# Altium schematic sheet 主体.schdoc
size 297 x 209 mm; Symbol: Drawing-Symbol_A4; @Create Time: 10:59:36; @Update Time: 20:11:28; Border: 1; Width: 1170; Height: 825; Region Start: 1; X Region Count: 6; Y Region Count: 4; Blade Width: 10; Title Block Position: 3; Title Block: 1; @Board Name: Board1; Company: 嘉立创EDA; Version: V1.0; Page Size: A4; @Project Name: stm32f4; @Page Count: 3; @Update Date: 2025-11-17; @Create Date: 2025-10-30; @Schematic Name: Schematic1; @Page No: 1; @Page Name: 主体; Device: Drawing-Symbol_A4
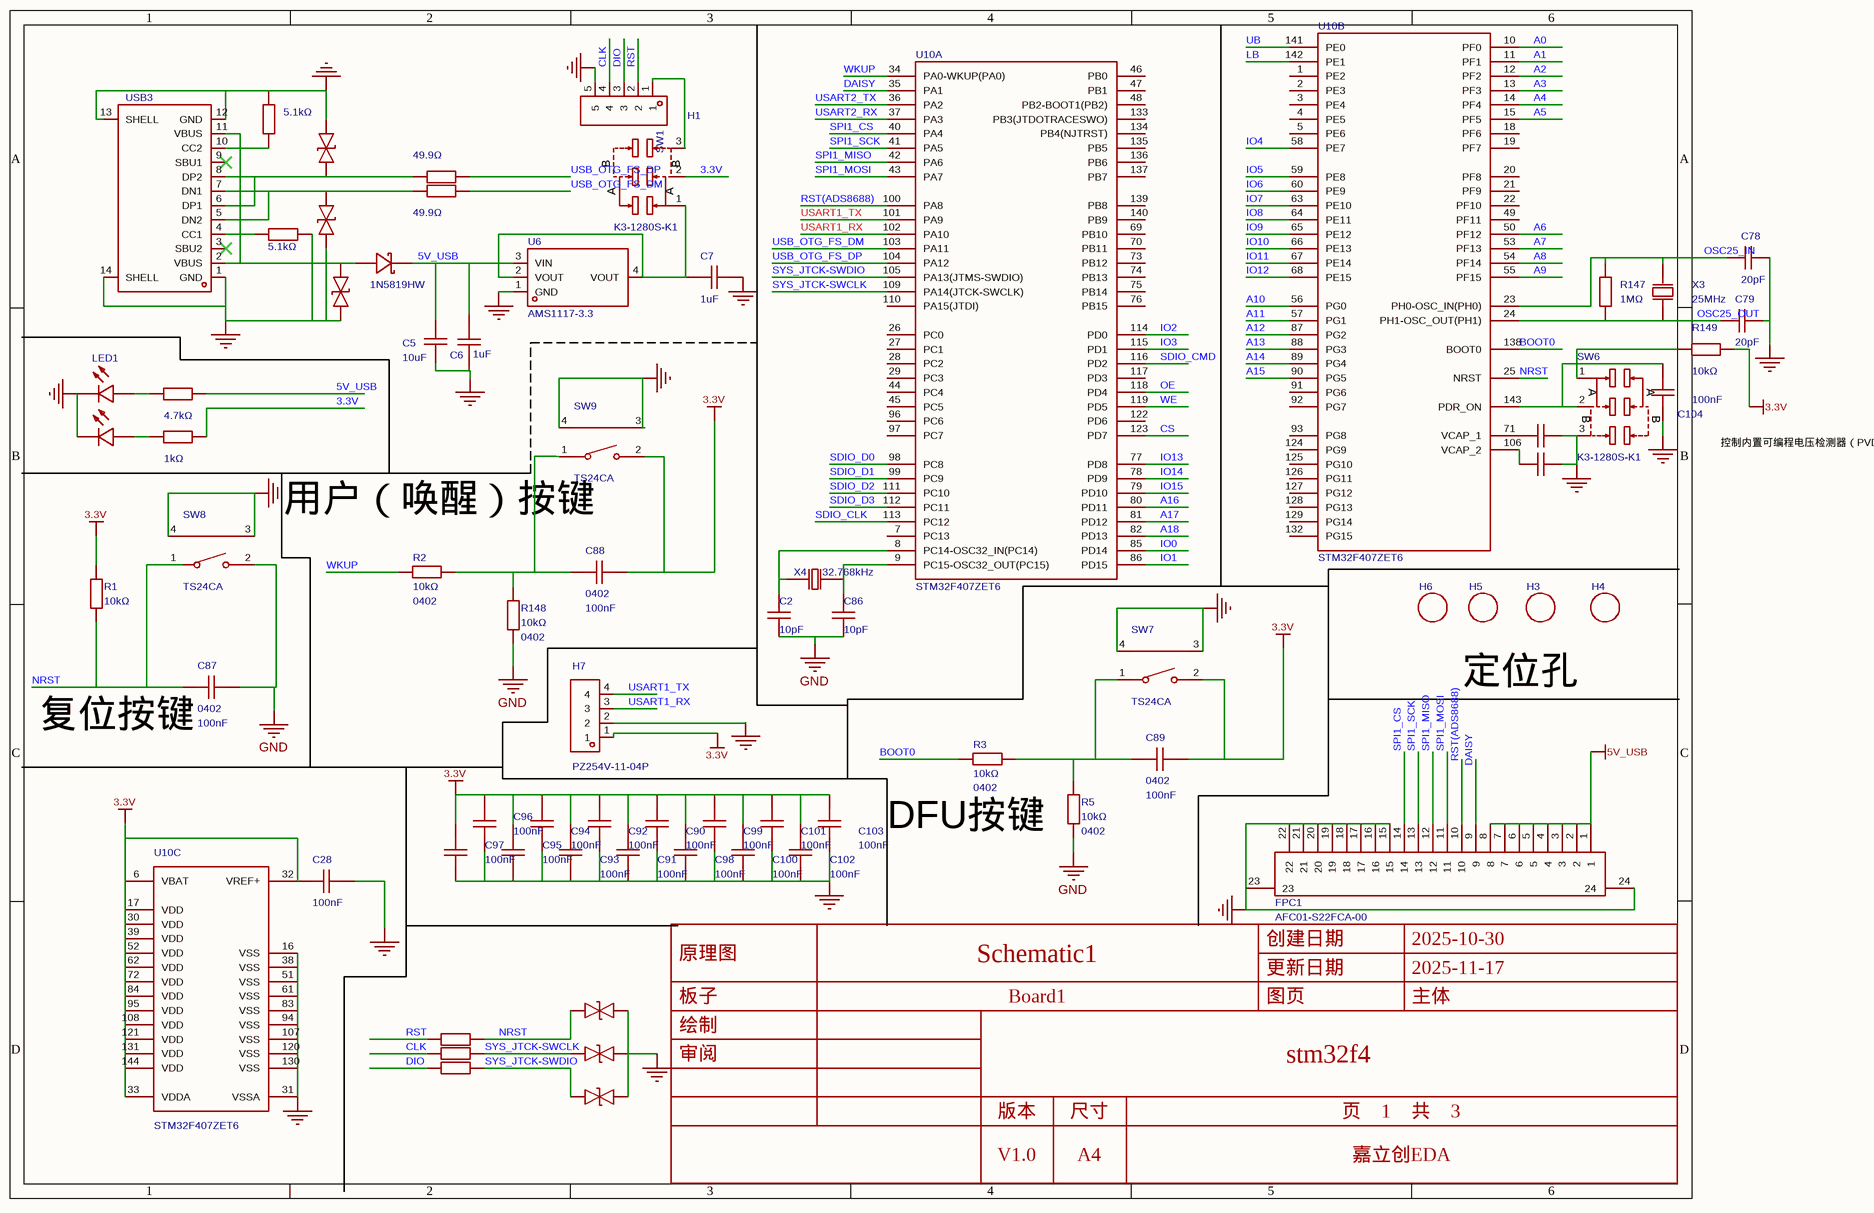
[diagram p0: 主体.schdoc]

## Parts
C2  value 10pF  [r0402]
C5  10uF  [C0603]
C6  1uF  [C0603]
C7  1uF  [C0603]
C28  100nF  [C0603]
C78  20pF  [C0603]
C79  20pF  [C0603]
C80  2.2uF  [C0603]  (value not drawn)
C81  2.2uF  [C0603]  (value not drawn)
C86  value 10pF  [r0402]
C87  value 100nF  Supplier Footprint: 0402  [C0402]  (hidden comment: CC0402KRX7R7BB104)
C88  value 100nF  Supplier Footprint: 0402  [C0402]  (hidden comment: CC0402KRX7R7BB104)
C89  value 100nF  Supplier Footprint: 0402  [C0402]  (hidden comment: CC0402KRX7R7BB104)
C90  100nF  [C0402]
C91  100nF  [C0402]
C92  100nF  [C0402]
C93  100nF  [C0402]
C94  100nF  [C0402]
C95  100nF  [C0402]
C96  100nF  [C0402]
C97  100nF  [C0402]
C98  100nF  [C0402]
C99  100nF  [C0402]
C100  100nF  [C0402]
C101  100nF  [C0402]
C102  100nF  [C0402]
C103  100nF  [C0402]
C104  100nF  [C0402]
D9  0603ESDA-05N  [D0603-BI]  (value not drawn)
D10  0603ESDA-05N  [D0603-BI]  (value not drawn)
D11  0603ESDA-05N  [D0603-BI]  (value not drawn)
D13  LESD5D5.0CT1G  [SOD-523_L1.2-W0.8-LS1.6-BI]  (value not drawn)
D14  LESD5D5.0CT1G  [SOD-523_L1.2-W0.8-LS1.6-BI]  (value not drawn)
D15  LESD5D5.0CT1G  [SOD-523_L1.2-W0.8-LS1.6-BI]  (value not drawn)
D16  1N5819HW  [SOD-123_L2.7-W1.6-LS3.7-RD-1]
FPC1  AFC01-S22FCA-00  [FPC-SMD_P0.5-22P_FGS-XJ-H2.0]
H1  PZ254V-11-05P  [HDR-TH_5P-P2.54-V-M]  (value not drawn)
H3  m3_3  [m3 125x300]  (value not drawn)
H4  m3_3  [m3 125x300]  (value not drawn)
H5  m3_3  [m3 125x300]  (value not drawn)
H6  m3_3  [m3 125x300]  (value not drawn)
H7  PZ254V-11-04P  [HDR-TH_4P-P2.54-V-M]
LED1  19-217/R6C-AL1M2VY/3T  [LED0603-RD]  (value not drawn)
LED5  19-213/Y2C-CQ2R2L/3T(CY)  [LED0603-RD-YELLOW]  (value not drawn)
R1  value 10kΩ  [R0402]  (hidden comment: RC0402FR-0710KL)
R2  value 10kΩ  Supplier Footprint: 0402  [R0402]  (hidden comment: RC0402FR-0710KL)
R3  value 10kΩ  Supplier Footprint: 0402  [R0402]  (hidden comment: RC0402FR-0710KL)
R5  value 10kΩ  Supplier Footprint: 0402  [R0402]  (hidden comment: RC0402FR-0710KL)
R7  49.9Ω  [R0603]  (value not drawn)
R8  49.9Ω  [R0603]  (value not drawn)
R9  49.9Ω  [R0603]  (value not drawn)
R21  value 49.9Ω  [R0603]  (hidden comment: 0603WAF499JT5E)
R22  value 49.9Ω  [R0603]  (hidden comment: 0603WAF499JT5E)
R24  5.1kΩ  [R0402]
R25  5.1kΩ  [R0402]
R26  4.7kΩ  [R0402]
R27  1kΩ  [R0402]
R147  1MΩ  [R0603]
R148  value 10kΩ  Supplier Footprint: 0402  [R0402]  (hidden comment: RC0402FR-0710KL)
R149  10kΩ  [R0402]
SW1  K3-1280S-K1  [SW-SMD_K3-1280S-K1]
SW6  K3-1280S-K1  [SW-SMD_K3-1280S-K1]
SW7  TS24CA  [SW-SMD_2P-TS24CA]
SW8  TS24CA  [SW-SMD_2P-TS24CA]
SW9  TS24CA  [SW-SMD_2P-TS24CA]
U6  AMS1117-3.3  [SOT-223-3_L6.5-W3.4-P2.30-LS7.0-BR]
U10  STM32F407ZET6  [LQFP-144_L20.0-W20.0-P0.50-LS22.0-BL]  (parts A,B,C of 3)
USB3  TYPE-C 16PIN 2MD(073)  [USB-C-SMD_TYPE-C-6PIN-2MD-073]  (value not drawn)
X3  25MHz  [OSC-SMD_L5.0-W3.2]
X4  value 32.768kHz  [crystal-smd_l3.2-w1.5-1]

## Nets
3.3V: C28.1 C88.1 C89.1 C90.1 C91.1 C92.1 C93.1 C94.1 C95.1 C96.1 C97.1 C98.1 C99.1 C100.1 C101.1 C102.1 C103.1 H7.1 R1.1 R27.2 R149.2 SW1.2 SW7.2 SW9.2 U10.6(VBAT) U10.17(VDD) U10.30(VDD) U10.32(VREF+) U10.33(VDDA) U10.39(VDD) U10.52(VDD) U10.62(VDD) U10.72(VDD) U10.84(VDD) U10.95(VDD) U10.108(VDD) U10.121(VDD) U10.131(VDD) U10.144(VDD)
5V_USB: C5.2 C6.2 D16.1(K) FPC1.1 FPC1.2 FPC1.3 FPC1.4 FPC1.5 FPC1.6 FPC1.7 FPC1.8 R26.2 U6.3(VIN)
GND: C2.1 C5.1 C6.1 C7.2 C28.2 C78.1 C79.1 C80.2 C81.2 C86.1 C87.1 C90.2 C91.2 C92.2 C93.2 C94.2 C95.2 C96.2 C97.2 C98.2 C99.2 C100.2 C101.2 C102.2 C103.2 C104.1 D9.2 D10.2 D11.2 D13.1 D14.1 D15.1 FPC1.15 FPC1.16 FPC1.17 FPC1.18 FPC1.19 FPC1.20 FPC1.21 FPC1.22 FPC1.23 FPC1.24 H1.5 H7.2 LED1.1(C) LED5.1(C) R5.2 R24.2 R25.2 R148.2 SW6.3 SW7.3 SW7.4 SW8.2 SW8.3 SW8.4 SW9.3 SW9.4 U6.1(GND) U10.16(VSS) U10.31(VSSA) U10.38(VSS) U10.51(VSS) U10.61(VSS) U10.83(VSS) U10.94(VSS) U10.107(VSS) U10.120(VSS) U10.130(VSS) USB3.1(GND) USB3.12(GND) USB3.13(SHELL) USB3.14(SHELL)
A0: U10.10(PF0)
A1: U10.11(PF1)
A2: U10.12(PF2)
A3: U10.13(PF3)
A4: U10.14(PF4)
A5: U10.15(PF5)
A6: U10.50(PF12)
A7: U10.53(PF13)
A8: U10.54(PF14)
A9: U10.55(PF15)
A10: U10.56(PG0)
A11: U10.57(PG1)
A12: U10.87(PG2)
A13: U10.88(PG3)
A14: U10.89(PG4)
A15: U10.90(PG5)
A16: U10.80(PD11)
A17: U10.81(PD12)
A18: U10.82(PD13)
BOOT0: R3.1 U10.138(BOOT0)
CLK: H1.4 R8.1
CS: U10.123(PD7)
DAISY: FPC1.9 U10.35(PA1)
DIO: H1.3 R9.1
IO0: U10.85(PD14)
IO1: U10.86(PD15)
IO2: U10.114(PD0)
IO3: U10.115(PD1)
IO4: U10.58(PE7)
IO5: U10.59(PE8)
IO6: U10.60(PE9)
IO7: U10.63(PE10)
IO8: U10.64(PE11)
IO9: U10.65(PE12)
IO10: U10.66(PE13)
IO11: U10.67(PE14)
IO12: U10.68(PE15)
IO13: U10.77(PD8)
IO14: U10.78(PD9)
IO15: U10.79(PD10)
LB: U10.142(PE1)
NRST: C87.2 D9.1 R1.2 R7.2 SW8.1 U10.25(NRST)
OE: U10.118(PD4)
OSC25_IN: C78.2 R147.2 U10.23(PH0-OSC_IN(PH0)) X3.2(OSC2)
OSC25_OUT: C79.2 R147.1 U10.24(PH1-OSC_OUT(PH1)) X3.1(OSC1)
RST: H1.2 R7.1
RST(ADS8688): FPC1.10 U10.100(PA8)
SDIO_CLK: U10.113(PC12)
SDIO_CMD: U10.116(PD2)
SDIO_D0: U10.98(PC8)
SDIO_D1: U10.99(PC9)
SDIO_D2: U10.111(PC10)
SDIO_D3: U10.112(PC11)
SPI1_CS: FPC1.14 U10.40(PA4)
SPI1_MISO: FPC1.12 U10.42(PA6)
SPI1_MOSI: FPC1.11 U10.43(PA7)
SPI1_SCK: FPC1.13 U10.41(PA5)
SYS_JTCK-SWCLK: D10.1 R8.2 U10.109(PA14(JTCK-SWCLK))
SYS_JTCK-SWDIO: D11.1 R9.2 U10.105(PA13(JTMS-SWDIO))
UB: U10.141(PE0)
USART1_RX: H7.3 U10.102(PA10)
USART1_TX: H7.4 U10.101(PA9)
USART2_RX: U10.37(PA3)
USART2_TX: U10.36(PA2)
USB_OTG_FS_DM: R22.1 U10.103(PA11)
USB_OTG_FS_DP: R21.1 U10.104(PA12)
WE: U10.119(PD5)
WKUP: R2.1 U10.34(PA0-WKUP(PA0))
NetC2_2: C2.2 U10.8(PC14-OSC32_IN(PC14)) X4.1
NetC7_1: C7.1 SW1.1 U6.2(VOUT) U6.4(VOUT)
NetC80_1: C80.1 U10.71(VCAP_1)
NetC81_1: C81.1 U10.106(VCAP_2)
NetC86_2: C86.2 U10.9(PC15-OSC32_OUT(PC15)) X4.2
NetC88_2: C88.2 R2.2 R148.1 SW9.1
NetC89_2: C89.2 R3.2 R5.1 SW7.1
NetC104_2: C104.2 SW6.2 U10.143(PDR_ON)
NetD13_2: D13.2 R21.2 USB3.6(DP1) USB3.8(DP2)
NetD14_2: D14.2 R22.2 USB3.5(DN2) USB3.7(DN1)
NetD15_2: D15.2 D16.2(A) USB3.2(VBUS) USB3.11(VBUS)
NetH1_1: H1.1 SW1.3
NetLED1_2: LED1.2(A) R26.1
NetLED5_2: LED5.2(A) R27.1
NetR24_1: R24.1 USB3.10(CC2)
NetR25_1: R25.1 USB3.4(CC1)
NetR149_1: R149.1 SW6.1

Not connected (* = marked no-connect by the designer): U10 1(PE2) 2(PE3) 3(PE4) 4(PE5) 5(PE6) 7(PC13) 18(PF6) 19(PF7) 20(PF8) 21(PF9) 22(PF10) 26(PC0) 27(PC1) 28(PC2) 29(PC3) 44(PC4) 45(PC5) 46(PB0) 47(PB1) 48(PB2-BOOT1(PB2)) 49(PF11) 69(PB10) 70(PB11) 73(PB12) 74(PB13) 75(PB14) 76(PB15) 91(PG6) 92(PG7) 93(PG8) 96(PC6) 97(PC7) 110(PA15(JTDI)) 117(PD3) 122(PD6) 124(PG9) 125(PG10) 126(PG11) 127(PG12) 128(PG13) 129(PG14) 132(PG15) 133(PB3(JTDOTRACESWO)) 134(PB4(NJTRST)) 135(PB5) 136(PB6) 137(PB7) 139(PB8) 140(PB9); USB3 3(SBU2)* 9(SBU1)*

## Notes on the sheet
- 控制内置可编程电压检测器（PVD）的开启/关闭
- 用户（唤醒）按键
- 定位孔
- 复位按键
- DFU按键
- 创建日期
- 2025-10-30
- 原理图
- 板子
- Schematic1
- Board1
- 更新日期
- 图页
- 2025-11-17
- 主体
- 绘制
- 审阅
- stm32f4
- 版本
- V1.0
- 尺寸
- A4
- 页    1    共    3
- 嘉立创EDA
- (in symbol K3-1280S-K1) B; A

## Library data of the parts
C2 C86 = CC0402JRNPO9BN100: 容值:10pF;精度:±5%;额定电压:50V;温度系数:NP0;; Manufacturer: YAGEO(国巨); AddInBom: yes; ModelId: 36a51122f27c49738f86b3bfa98863e0; ModelName: C0402_L1.0-W0.5-H0.5; ModelTransform: 39.37,19.685,0,0,0,0,0,0,0; Tolerance: ±5%; Voltage Rated: 50V; Temperature Coefficient: NP0; Device: CC0402JRNPO9BN100; Symbol: cc0402jrnpo9bn100; LCSC Part Name: 10pF ±5% 50V; SupplierPart: C106199; ManufacturerPart: CC0402JRNPO9BN100; Supplier Footprint: 0402; JLCPCB Part Class: Extended Part; Datasheet: https://atta.szlcsc.com/upload/public/pdf/source/20170518/1495085708228.pdf; Supplier: LCSC; ConvertToPcb: yes; FootprintName: r0402
C5 = 0603X106K100NT: 容值:10uF;精度:±10%;额定电压:10V;材质(温度系数):X5R;; Manufacturer: FH(风华); AddInBom: yes; ModelId: ac125912035d415993ca9572d50418b1; ModelName: C0603_L1.6-W0.8-H0.8; ModelTransform: 62.992,31.496,0,0,0,0,0,0,0; Tolerance: ±10%; Voltage Rated: 10V; Temperature Coefficient: X5R; Device: 0603X106K100NT; Symbol: 0603X106K100NT; LCSC Part Name: 10uF ±10% 10V; SupplierPart: C38898; ManufacturerPart: 0603X106K100NT; Supplier Footprint: 0603; Datasheet: https://atta.szlcsc.com/upload/public/pdf/source/20170923/C38898_1506149449306988751.pdf; Supplier: LCSC; ConvertToPcb: yes; FootprintName: C0603; Value: 10uF
C6 C7 = CL10A105KB8NNNC: 容值:1uF;精度:±10%;额定电压:50V;温度系数:X5R;; Manufacturer: SAMSUNG(三星); AddInBom: yes; ModelId: ac125912035d415993ca9572d50418b1; ModelName: C0603_L1.6-W0.8-H0.8; ModelTransform: 62.992,31.496,0,0,0,0,0,0,0; Tolerance: ±10%; Voltage Rating: 50V; Temperature Coefficient: X5R; Symbol: CL10A105KB8NNNC; Device: CL10A105KB8NNNC; LCSC Part Name: 1uF ±10% 50V; SupplierPart: C15849; ManufacturerPart: CL10A105KB8NNNC; Supplier Footprint: 0603; JLCPCB Part Class: 基础库; Datasheet: https://item.szlcsc.com/datasheet/CL10A105KB8NNNC/16531.html; Supplier: LCSC; ConvertToPcb: yes; FootprintName: C0603; Value: 1uF
C28 = CC0603KRX7R9BB104: 容值:100nF;精度:±10%;额定电压:50V;材质(温度系数):X7R;; Manufacturer: YAGEO(国巨); Voltage Rating: 50V; AddInBom: yes; ModelId: ac125912035d415993ca9572d50418b1; ModelName: C0603_L1.6-W0.8-H0.8; ModelTransform: 62.992,31.496,0,0,0,0,0,0,0; Tolerance: ±10%; Temperature Coefficient: X7R; Symbol: CC0603KRX7R9BB104; Device: CC0603KRX7R9BB104; LCSC Part Name: 100nF ±10% 50V; SupplierPart: C14663; ManufacturerPart: CC0603KRX7R9BB104; Supplier Footprint: 0603; JLCPCB Part Class: 基础库; Datasheet: https://atta.szlcsc.com/upload/public/pdf/source/20180910/C282072_33301C7F631E79921B82A8DAC6BCC5B3.pdf; Supplier: LCSC; ConvertToPcb: yes; FootprintName: C0603; Value: 100nF; Voltage Rated: 50V
C78 C79 = CL10C200JB8NNNC: 容值:20pF;精度:±5%;额定电压:50V;温度系数:C0G;; Manufacturer: SAMSUNG(三星); AddInBom: yes; ModelId: ac125912035d415993ca9572d50418b1; ModelName: C0603_L1.6-W0.8-H0.8; ModelTransform: 62.992,31.496,0,0,0,0,0,0,0; Tolerance: ±5%; Voltage Rating: 50V; Temperature Coefficient: C0G; Symbol: CL10C200JB8NNNC; Device: CL10C200JB8NNNC; LCSC Part Name: 20pF ±5% 50V; SupplierPart: C1648; ManufacturerPart: CL10C200JB8NNNC; Supplier Footprint: 0603; JLCPCB Part Class: 基础库; Datasheet: https://item.szlcsc.com/datasheet/CL10C200JB8NNNC/2000.html; Supplier: LCSC; ConvertToPcb: yes; FootprintName: C0603; Value: 20pF
C80 C81 = CL10A225KO8NNNC: 容值:2.2uF;精度:±10%;额定电压:16V;温度系数:X5R;; Manufacturer: SAMSUNG(三星); AddInBom: yes; ModelId: ac125912035d415993ca9572d50418b1; ModelName: C0603_L1.6-W0.8-H0.8; ModelTransform: 62.992,31.496,0,0,0,0,0,0,0; Tolerance: ±10%; Voltage Rating: 16V; Temperature Coefficient: X5R; Symbol: CL10A225KO8NNNC; Device: CL10A225KO8NNNC; LCSC Part Name: 2.2uF ±10% 16V; SupplierPart: C23630; ManufacturerPart: CL10A225KO8NNNC; Supplier Footprint: 0603; JLCPCB Part Class: 基础库; Datasheet: https://item.szlcsc.com/datasheet/CL10A225KO8NNNC/24366.html; Supplier: LCSC; ConvertToPcb: yes; FootprintName: C0603; Value: 2.2uF
C87-C89 C104 = CC0402KRX7R7BB104: 容值:100nF;精度:±10%;额定电压:16V;材质(温度系数):X7R;; Manufacturer: YAGEO(国巨); AddInBom: yes; ModelId: 36a51122f27c49738f86b3bfa98863e0; ModelName: C0402_L1.0-W0.5-H0.5; ModelTransform: 39.37,19.685,0,0,0,0,0,0,0; Tolerance: ±10%; Voltage Rated: 16V; Temperature Coefficient: X7R; Device: CC0402KRX7R7BB104; Symbol: CC0402KRX7R7BB104; LCSC Part Name: 100nF ±10% 16V; SupplierPart: C60474; ManufacturerPart: CC0402KRX7R7BB104; Datasheet: https://atta.szlcsc.com/upload/public/pdf/source/20211223/9278FD768280B81DDBEF48FA36411A03.pdf; Supplier: LCSC; ConvertToPcb: yes; FootprintName: C0402
  C104: Supplier Footprint: 0402; Value: 100nF
C90-C103 = CL05B104KB54PNC: 容值:100nF;精度:±10%;额定电压:50V;温度系数:X7R;; Manufacturer: SAMSUNG(三星); AddInBom: yes; ModelId: 36a51122f27c49738f86b3bfa98863e0; ModelName: C0402_L1.0-W0.5-H0.5; ModelTransform: 39.37,19.685,0,0,0,0,0,0,0; Tolerance: ±10%; Voltage Rating: 50V; Temperature Coefficient: X7R; Symbol: CL05B104KB54PNC; Device: CL05B104KB54PNC; LCSC Part Name: 100nF ±10% 50V; SupplierPart: C307331; ManufacturerPart: CL05B104KB54PNC; Supplier Footprint: 0402; JLCPCB Part Class: 基础库; Datasheet: https://item.szlcsc.com/datasheet/CL05B104KB54PNC/291005.html; Supplier: LCSC; ConvertToPcb: yes; FootprintName: C0402; Value: 100nF
D9-D11 = 0603ESDA-05N: 极性:双向;反向截止电压(Vrwm):5V;钳位电压:50V;; Manufacturer: BORN(伯恩半导体); AddInBom: yes; ModelId: a387ce2936f842ebafc868b09fdf8ecc; ModelName: DO0603_L1.6-W0.8-H0.8-LS1.6; ModelTransform: 62.992,31.496,0,0,0,0,0,0,0; Polarity: 双向; Reverse Stand-Off Voltage (Vrwm): 5V; Clamping Voltage: 50V; Reverse Leakage Current (Ir): 500nA; level of protection: IEC 61000-4-2; Type: ESD; Junction Capacitance: 1.5pF; Symbol: 0603ESDA-05N; Device: 0603ESDA-05N; LCSC Part Name: 双向ESD 5V截止; SupplierPart: C316054; ManufacturerPart: 0603ESDA-05N; Supplier Footprint: 0603; JLCPCB Part Class: 扩展库; Datasheet: https://item.szlcsc.com/datasheet/0603ESDA-05N/297742.html; Supplier: LCSC; ConvertToPcb: yes; FootprintName: D0603-BI
D13-D15 = LESD5D5.0CT1G: 极性:双向;反向截止电压(Vrwm):5V;钳位电压:18.6V;峰值脉冲电流(Ipp):9.4A@8/20us;峰值脉冲功率(Ppp):150W@8/20us;击穿电压:7.8V;; Manufacturer: LRC(乐山无线电); AddInBom: yes; ModelId: bfbc20aaa9964d25bc07bd43d1c87046; ModelTransform: 62.992,31.496,0,0,0,0,0,0,0; Polarity: 双向; Reverse Stand-Off Voltage (Vrwm): 5V; Clamping Voltage: 18.6V; Voltage - Breakdown: 7.8V; Reverse Leakage Current (Ir): 1uA; level of protection: IEC 61000-4-4；IEC 61000-4-2; Type: ESD; Junction Capacitance: 15pF; Symbol: LESD5D5.0CT1G; Device: LESD5D5.0CT1G; LCSC Part Name: 双向ESD 5V截止 峰值脉冲电流：9.4A@8/20us; SupplierPart: C383211; ManufacturerPart: LESD5D5.0CT1G; Supplier Footprint: SOD-523; JLCPCB Part Class: 扩展库; Datasheet: https://item.szlcsc.com/datasheet/LESD5D5.0CT1G/356518.html; Supplier: LCSC; ConvertToPcb: yes; FootprintName: SOD-523_L1.2-W0.8-LS1.6-BI; ModelName: SOD-523_L1.2-W0.8-LS1.6-BI; Peak Pulse Current (Ipp): 9.4A@8/20us; Peak Pulse Power Dissipation (Ppp): 150W@8/20us; Operating Temperature: -40℃~+125℃
D16 = 1N5819HW: 二极管配置:-;正向压降(Vf):900mV@3A;直流反向耐压(Vr):40V;整流电流:1A;; Manufacturer: TECH PUBLIC(台舟); AddInBom: yes; ModelId: 528459655f7d4601a76356f3191c812b; ModelTransform: 151.575,66.929,0,0,0,0,0,0,0; Voltage - DC Reverse(Vr): 40V; Current - Rectified: 1A; Reverse Leakage Current (Ir): 1mA@40V; Non-Repetitive Peak Forward Surge Current: 9A; Symbol: 1N5819HW; Device: 1N5819HW; LCSC Part Name: 电压:40V 电流:1A; SupplierPart: C2905649; ManufacturerPart: 1N5819HW; Supplier Footprint: SOD-123; JLCPCB Part Class: 扩展库; Datasheet: https://item.szlcsc.com/datasheet/1N5819HW/3175946.html; Supplier: LCSC; ConvertToPcb: yes; FootprintName: SOD-123_L2.7-W1.6-LS3.7-RD-1; ModelName: SOD-123_L2.7-W1.6-LS3.7-RD-1; Diode Configuration: -; Voltage - Forward(Vf@If): 900mV@3A
FPC1 = AFC01-S22FCA-00: 锁定特性:翻盖式;触点类型:下接;触点数量:22P;间距:0.5mm;安装类型:卧贴;; Manufacturer: JS(钜硕电子); AddInBom: yes; ModelId: 12d9165dec84425d968f174b1be8289a; ModelTransform: 610.235,240.157,0,0,0,0,0,57.008,0; Locking Feature: 翻盖式; Number of Contacts: 22P; Pitch: 0.5mm; FFC, FCB Thickness: 0.3mm; Symbol: AFC01-S22FCA-00; Device: AFC01-S22FCA-00; LCSC Part Name: 间距:0.5mm P数:22P 翻盖式 下接; SupplierPart: C262668; ManufacturerPart: AFC01-S22FCA-00; Supplier Footprint: SMD,P=0.5mm,卧贴; JLCPCB Part Class: 扩展库; Datasheet: https://atta.szlcsc.com/upload/public/pdf/source/20190816/C413942_2A72D1AC756EAE17EEDF756A339D4500.pdf; Supplier: LCSC; ConvertToPcb: yes; FootprintName: FPC-SMD_P0.5-22P_FGS-XJ-H2.0; ModelName: FPC-SMD_P0.5-22P_FGS-XJ-H2.0; Contact Type: 下接; Mounting Type: 卧贴; Height Above Board: 2mm
H1 = PZ254V-11-05P: 插针结构:1x5P;间距:2.54mm;行距:-;圆针/方针:方针;安装方式:直插;排数:单排;总PIN位数:5P;额定电流:-;额定电压:-;配合针长度:6mm;塑高:2.5mm;端接针长度:3mm;触头材质:黄铜;触头镀层:-;工作温度:-40℃~+105℃;颜色:黑色;; Manufacturer: XFCN(兴飞); AddInBom: yes; ModelId: 47d466e4a34f4fc5bc626cf773a24dd5; ModelName: HDR-TH_5P-P2.54-M-LI-1X5P; ModelTransform: 499.999,100,0,0,0,0,0,0,-118.11; Pin Structure: 1x5P; Pitch: 2.54mm; Circluar Pins/Square Pins: 方针; Symbol: PZ254V-11-05P; Device: PZ254V-11-05P; LCSC Part Name: 1x5P 间距:2.54mm 方针 直插; SupplierPart: C492404; ManufacturerPart: PZ254V-11-05P; Supplier Footprint: 插件,P=2.54mm; JLCPCB Part Class: 扩展库; Datasheet: https://atta.szlcsc.com/upload/public/pdf/source/20200309/C492404_E51533260F8710EFF5D4617281164C1D.pdf; Supplier: LCSC; ConvertToPcb: yes; FootprintName: HDR-TH_5P-P2.54-V-M; Row Spacing: -; Mounting Type: 直插; Number of Rows: 单排; Number of Pins: 5P; Current Rating: -; Voltage Rating (Max): -; Length of Mating Pin: 6mm; Insulation Height: 2.5mm; Length of End Connection Pin: 3mm; Contact Material: 黄铜; Contact Plating: -; Operating Temperature: -40℃~+105℃; Color: 黑色
H3-H6 = m3_3: Symbol: m3; AddInBom: yes; Device: m3_3; ConvertToPcb: yes; FootprintName: m3 125x300
H7 = PZ254V-11-04P: 插针结构:1x4P;间距:2.54mm;行距:-;圆针/方针:方针;安装方式:直插;排数:单排;总PIN位数:4P;额定电流:3A;额定电压:250V;配合针长度:6mm;塑高:2.5mm;端接针长度:3mm;触头材质:-;工作温度:-40℃~+105℃;颜色:黑色;; Manufacturer: XFCN(兴飞); Symbol: PZ254V-11-04P_C2691448; AddInBom: yes; ModelId: 112f4d05e8d64e99ab9a333894bea4f9; ModelName: HDR-TH_4P-P2.54-M-LI-1X4P; ModelTransform: 399.999,104.7242,0,0,0,0,0,0,-118.11; Pin Structure: 1x4P; Pitch: 2.54mm; Circluar Pins/Square Pins: 方针; Current Rating: 3A; Voltage Rating (Max): 250V; Device: PZ254V-11-04P; LCSC Part Name: 1x4P 间距:2.54mm 方针 直插; SupplierPart: C2691448; ManufacturerPart: PZ254V-11-04P; Supplier Footprint: 插件,P=2.54mm; JLCPCB Part Class: 扩展库; Datasheet: https://item.szlcsc.com/datasheet/PZ254V-11-04P/2801085.html; Supplier: LCSC; ConvertToPcb: yes; FootprintName: HDR-TH_4P-P2.54-V-M; Row Spacing: -; Mounting Type: 直插; Number of Rows: 单排; Number of Pins: 4P; Length of Mating Pin: 6mm; Insulation Height: 2.5mm; Length of End Connection Pin: 3mm; Contact Material: -; Operating Temperature: -40℃~+105℃; Color: 黑色
LED1 = 19-217/R6C-AL1M2VY/3T: 发光颜色:红色;正向压降(Vf):1.95V;功率:60mW;正向电流:5mA;波长:617.5nm;二极管配置:-;透镜颜色:无色透明透镜;色温:-;发光角度:120°;载带方式:-;工作温度:-40℃~+85℃;; Manufacturer: EVERLIGHT(亿光); AddInBom: yes; ModelId: 1f0d29a91be547639d425604e9b96ebb; ModelTransform: 63.7794,32.283,0,0,0,0,0,0,0; Illumination Color: 红色; Voltage - Forward(Vf): 1.95V; Power(Watts): 60mW; Forward Current: 5mA; Peak Wavelength: 632nm; Lens Color: 无色透明透镜; Viewing Angle: 120°; Symbol: 19-217/R6C-AL1M2VY/3T; Device: 19-217/R6C-AL1M2VY/3T; LCSC Part Name: 红灯 停产; SupplierPart: C72044; ManufacturerPart: 19-217/R6C-AL1M2VY/3T; Supplier Footprint: 0603; JLCPCB Part Class: 扩展库; Supplier: LCSC; ConvertToPcb: yes; FootprintName: LED0603-RD; ModelName: LED0603-RD; Wavelength - Dominant: 617.5nm; Diode Configuration: -; Color Temperature: -; Mounting Style: -; Operating Temperature: -40℃~+85℃
LED5 = 19-213/Y2C-CQ2R2L/3T(CY): 发光颜色:黄灯;二极管配置:-;主波长:585.5nm~591.5nm;色温:-;功率:60mW;安装方式:-;; Manufacturer: EVERLIGHT(亿光); AddInBom: yes; ModelId: a8fc7d5425514cf49dd600af0a7bb223; ModelTransform: 63.7794,32.283,0,0,0,0,-1.969,0,0; Emitted Color: 黄灯; Lens Color: 无色透明; Peak Wavelength: 591nm; Forward Current: 20mA; Power Dissipation: 60mW; Viewing Angle: 120°; Device: 19-213/Y2C-CQ2R2L/3T(CY); Symbol: 19-213/Y2C-CQ2R2L/3T(CY); LCSC Part Name: 黄灯; SupplierPart: C72038; ManufacturerPart: 19-213/Y2C-CQ2R2L/3T(CY); Supplier Footprint: 0603; JLCPCB Part Class: 基础库; Datasheet: https://atta.szlcsc.com/upload/public/pdf/source/20160507/1462613613586.pdf; Supplier: LCSC; ConvertToPcb: yes; FootprintName: LED0603-RD-YELLOW; ModelName: LED0603-RD-YELLOW; Diode Configuration: -; Dominant Wavelength: 585.5nm~591.5nm; Color Temperature: -; Mounting Sytle: -; Operating Temperature: -40℃~+85℃
R1-R3 R5 R148 = RC0402FR-0710KL: 电阻类型:厚膜电阻;阻值:10kΩ;精度:±1%;功率:62.5mW;; Manufacturer: YAGEO(国巨); AddInBom: yes; ModelId: 671aefced39d4c318694bba8bd8efd39; ModelName: R0402_L1.0-W0.5-H0.5; ModelTransform: 39.37,19.685,0,0,0,0,0,0.0005,0; Tolerance: ±1%; Power(Watts): 62.5mW; Temperature Coefficient: ±100ppm/℃; Overload Voltage (Max): 50V; Device: RC0402FR-0710KL; Symbol: RC0402FR-0710KL; LCSC Part Name: 10kΩ ±1% 62.5mW; SupplierPart: C60490; ManufacturerPart: RC0402FR-0710KL; JLCPCB Part Class: 扩展库; Datasheet: https://atta.szlcsc.com/upload/public/pdf/source/20170606/1496716515432.pdf; Supplier: LCSC; ConvertToPcb: yes; FootprintName: R0402; Type: 厚膜电阻; Operating Temperature Range: -55℃~+155℃
  R1: Supplier Footprint: 0402
R7-R9 R21 R22 = 0603WAF499JT5E: 电阻类型:厚膜电阻;阻值:49.9Ω;精度:±1%;功率:100mW;工作电压:75V;温度系数:±100ppm/℃;; Manufacturer: UNI-ROYAL(厚声); AddInBom: yes; ModelId: fc143cca1e79419f9cd78b61e9279f08; ModelTransform: 31.8897,63.7794,0,90,0,0,0,0,0; Tolerance: ±1%; Power(Watts): 100mW; Voltage-Supply(Max): 75V; Symbol: 0603WAF499JT5E; Device: 0603WAF499JT5E; LCSC Part Name: 49.9Ω ±1% 100mW 厚膜电阻; SupplierPart: C23185; ManufacturerPart: 0603WAF499JT5E; Supplier Footprint: 0603; JLCPCB Part Class: 基础库; Datasheet: https://item.szlcsc.com/datasheet/0603WAF499JT5E/23912.html; Supplier: LCSC; ConvertToPcb: yes; FootprintName: R0603; ModelName: R0603; Type: 厚膜电阻; Temperature Coefficient: ±100ppm/℃; Operating Temperature: -55℃~+155℃
  R7-R9: Value: 49.9Ω
R24 R25 = 0402WGF5101TCE: 电阻类型:厚膜电阻;阻值:5.1kΩ;精度:±1%;功率:62.5mW;工作电压:50V;温度系数:±100ppm/℃;; Manufacturer: UNI-ROYAL(厚声); AddInBom: yes; ModelId: 98c88bc2b9094f218f3a3e30a7012738; ModelName: R0402_L1.0-W0.5-H0.4; ModelTransform: 39.37,19.685,0,0,0,0,0,0,0; Tolerance: ±1%; Power(Watts): 62.5mW; Voltage-Supply(Max): 50V; Symbol: 0402WGF5101TCE; Device: 0402WGF5101TCE; LCSC Part Name: 5.1kΩ ±1% 62.5mW 厚膜电阻; SupplierPart: C25905; ManufacturerPart: 0402WGF5101TCE; Supplier Footprint: 0402; JLCPCB Part Class: 基础库; Datasheet: https://item.szlcsc.com/datasheet/0402WGF5101TCE/26648.html; Supplier: LCSC; ConvertToPcb: yes; FootprintName: R0402; Type: 厚膜电阻; Value: 5.1kΩ; Temperature Coefficient: ±100ppm/℃; Operating Temperature: -55℃~+155℃
R26 = 0402WGF4701TCE: 电阻类型:厚膜电阻;阻值:4.7kΩ;精度:±1%;功率:62.5mW;工作电压:50V;温度系数:±100ppm/℃;; Manufacturer: UNI-ROYAL(厚声); AddInBom: yes; ModelId: 98c88bc2b9094f218f3a3e30a7012738; ModelName: R0402_L1.0-W0.5-H0.4; ModelTransform: 39.37,19.685,0,0,0,0,0,0,0; Tolerance: ±1%; Power(Watts): 62.5mW; Voltage-Supply(Max): 50V; Symbol: 0402WGF4701TCE; Device: 0402WGF4701TCE; LCSC Part Name: 4.7kΩ ±1% 62.5mW 厚膜电阻; SupplierPart: C25900; ManufacturerPart: 0402WGF4701TCE; Supplier Footprint: 0402; JLCPCB Part Class: 基础库; Datasheet: https://item.szlcsc.com/datasheet/0402WGF4701TCE/26643.html; Supplier: LCSC; ConvertToPcb: yes; FootprintName: R0402; Type: 厚膜电阻; Value: 4.7kΩ; Temperature Coefficient: ±100ppm/℃; Operating Temperature: -55℃~+155℃
R27 = 0402WGF1001TCE: 电阻类型:厚膜电阻;阻值:1kΩ;精度:±1%;功率:62.5mW;工作电压:50V;温度系数:±100ppm/℃;; Manufacturer: UNI-ROYAL(厚声); AddInBom: yes; ModelId: 98c88bc2b9094f218f3a3e30a7012738; ModelName: R0402_L1.0-W0.5-H0.4; ModelTransform: 39.37,19.685,0,0,0,0,0,0,0; Tolerance: ±1%; Power(Watts): 62.5mW; Voltage-Supply(Max): 50V; Symbol: 0402WGF1001TCE; Device: 0402WGF1001TCE; LCSC Part Name: 1kΩ ±1% 62.5mW 厚膜电阻; SupplierPart: C11702; ManufacturerPart: 0402WGF1001TCE; Supplier Footprint: 0402; JLCPCB Part Class: 基础库; Datasheet: https://item.szlcsc.com/datasheet/0402WGF1001TCE/12256.html; Supplier: LCSC; ConvertToPcb: yes; FootprintName: R0402; Type: 厚膜电阻; Value: 1kΩ; Temperature Coefficient: ±100ppm/℃; Operating Temperature: -55℃~+155℃
R147 = 0603WAF1004T5E: 电阻类型:厚膜电阻;阻值:1MΩ;精度:±1%;功率:100mW;最大工作电压:75V;温度系数:±100ppm/℃;; Manufacturer: UNI-ROYAL(厚声); AddInBom: yes; ModelId: fc143cca1e79419f9cd78b61e9279f08; ModelTransform: 31.8897,63.7794,0,90,0,0,0,0,0; Tolerance: ±1%; Power(Watts): 100mW; Overload Voltage (Max): 75V; Symbol: 0603WAF1004T5E; Device: 0603WAF1004T5E; LCSC Part Name: 1MΩ ±1% 100mW 厚膜电阻; SupplierPart: C22935; ManufacturerPart: 0603WAF1004T5E; Supplier Footprint: 0603; JLCPCB Part Class: 基础库; Datasheet: https://atta.szlcsc.com/upload/public/pdf/source/20200306/C422600_1E6D84923E4A46A82E41ADD87F860B5C.pdf; Supplier: LCSC; ConvertToPcb: yes; FootprintName: R0603; ModelName: R0603; Type: 厚膜电阻; Value: 1MΩ; Temperature Coefficient: ±100ppm/℃; Operating Temperature Range: -55℃~+155℃
R149 = 0402WGF1002TCE: 电阻类型:厚膜电阻;阻值:10kΩ;精度:±1%;功率:62.5mW;工作电压:50V;温度系数:±100ppm/℃;; Manufacturer: UNI-ROYAL(厚声); AddInBom: yes; ModelId: 98c88bc2b9094f218f3a3e30a7012738; ModelName: R0402_L1.0-W0.5-H0.4; ModelTransform: 39.37,19.685,0,0,0,0,0,0,0; Tolerance: ±1%; Power(Watts): 62.5mW; Voltage-Supply(Max): 50V; Symbol: 0402WGF1002TCE; Device: 0402WGF1002TCE; LCSC Part Name: 10kΩ ±1% 62.5mW 厚膜电阻; SupplierPart: C25744; ManufacturerPart: 0402WGF1002TCE; Supplier Footprint: 0402; JLCPCB Part Class: 基础库; Datasheet: https://item.szlcsc.com/datasheet/0402WGF1002TCE/26487.html; Supplier: LCSC; ConvertToPcb: yes; FootprintName: R0402; Type: 厚膜电阻; Value: 10kΩ; Temperature Coefficient: ±100ppm/℃; Operating Temperature: -55℃~+155℃
SW1 SW6 = K3-1280S-K1: 电路结构:单刀双掷;安装方式:卧贴;开关颜色:黑色;额定电流:300mA;额定电压:6V;工作寿命:1万次;; Manufacturer: 韩国韩荣; AddInBom: yes; ModelId: ab25a683fa8b4ba5906172fee6c197a1; ModelTransform: 295.275,358.267,0,0,0,0,133.05,0,-23.622; Circuit: 单刀双掷; Actuator Style: 矩形柱状; Switch Height: 3.5mm; Actuator Color: 黑色; Current Rating: 300mA; Voltage Rating: 6V; Life: 1万次; Symbol: K3-1280S-K1; Device: K3-1280S-K1; LCSC Part Name: 卧贴双档 滑动开关; SupplierPart: C128953; ManufacturerPart: K3-1280S-K1; Supplier Footprint: SMD,9.1x3.7mm; JLCPCB Part Class: 扩展库; Datasheet: https://item.szlcsc.com/datasheet/K3-1280S-K1/140239.html; Supplier: LCSC; ConvertToPcb: yes; FootprintName: SW-SMD_K3-1280S-K1; ModelName: SW-SMD_K3-1280S-K1; Termination Style: 鸥翼型; Length: 9.1mm; Width: 3.7mm; Mounting Type: 卧贴; Operating Temperature: -25℃~+80℃
SW7-SW9 = TS24CA: 电路结构:单刀单掷;按钮形状:矩形按钮;安装方式:卧贴;开关长度:4.55mm;开关宽度:1.8mm;开关高度:3.5mm;触点电流:50mA;额定电压:12V;带灯:-;工作寿命:-;; Manufacturer: SHOU HAN(首韩); AddInBom: yes; ModelId: 40fd58424abd4d6abbbb880ec41c542e; ModelTransform: 185.039,142.9131,0,0,0,0,0,26.929,-15.748; Circuit: 单刀单掷; Actuator Style: 矩形按钮; Switch Height: 3.5mm; Contact Current: 50mA; Voltage Rating: 12V; Symbol: TS24CA; Device: TS24CA; LCSC Part Name: 4.55*1.8*3.5mm 卧贴 轻触开关; SupplierPart: C393942; ManufacturerPart: TS24CA; Supplier Footprint: SMD,4.6x1.8mm; JLCPCB Part Class: 扩展库; Datasheet: https://item.szlcsc.com/datasheet/TS24CA/372554.html; Supplier: LCSC; ConvertToPcb: yes; FootprintName: SW-SMD_2P-TS24CA; ModelName: SW-SMD_2P-TS24CA; Mounting Type: 卧贴; Length: 4.55mm; Width: 1.8mm; With Lamp: -; Life: -
U6 = AMS1117-3.3_C6186: 输出类型:固定;工作电压:16V;输出电压:3.3V;输出电流:1A;电源纹波抑制比(PSRR):72dB@(120Hz);输出极性:正极;; Manufacturer: AMS; AddInBom: yes; ModelId: 925194bf9823436183a3e0b978a8d076; ModelName: SOT-223-4P_L6.5-W3.5-H1.6-LS7.0-P2.30; ModelTransform: 279.89794,255.905,0,180,0,0,-3.9385,-0.0005,0; Output Type: 固定; Voltage - Supply: 16V; Output Voltage: 3.3V; Output Current: 1A; Voltage Dropout: 1.1V@(800mA); standby current: 5mA; Noise: 0.003%Vout; Output Configuration: 正极; Number of Outputs: 1; Symbol: AMS1117-3.3; Device: AMS1117-3.3_C6186; LCSC Part Name: 输出3.3V 1A; SupplierPart: C6186; ManufacturerPart: AMS1117-3.3; Supplier Footprint: SOT-223; JLCPCB Part Class: 基础库; Datasheet: https://item.szlcsc.com/datasheet/AMS1117-3.3/6652.html; Supplier: LCSC; ConvertToPcb: yes; FootprintName: SOT-223-3_L6.5-W3.4-P2.30-LS7.0-BR; Power Supply Rejection Ratio (PSRR): 72dB@(120Hz); Features: 过流保护；过热保护; Operating Temperature: -40℃~+125℃
U10 = STM32F407ZET6: CPU位数:32-Bit;ROM类型:FLASH;CPU内核:ARM® Cortex®-M4;主频（MAX):168MHz;工作电压:1.8V ~ 3.6V;; Manufacturer: ST(意法半导体); Relevance: []; AddInBom: yes; ModelId: 46049659436c43e8bd1e5c2b84034010; ModelName: LQFP-144_L20.0-W20.0-H1.4-LS22.0-P0.50; ModelTransform: 866.36,866.36,0,0,0,0,0.002,-0.001,0; Core Size: 32-Bit; Program Memory Type: FLASH; Speed: 168MHz; Program Memory Size: 512KB; RAM Size: 192KB; Number of I/O: 114; A/D: 24x12bit; D/A: 2x12bit; PWM: 56; LCD: MOTOROLA 6800 AND INTEL  8080 TYPE LCD DIRECTLY; UART/USART: 4 USART+2 UART; SPI: 3; USB Device: 1; CAN: 2; Ethernet: 10/100 Ethernet MAC; Device: STM32F407ZET6; Symbol: STM32F407ZET6; LCSC Part Name: STM32F407ZET6; SupplierPart: C36869; ManufacturerPart: STM32F407ZET6; Supplier Footprint: LQFP-144_20x20x05P; JLCPCB Part Class: Extended Part; Datasheet: https://atta.szlcsc.com/upload/public/pdf/source/20160816/1471342957598.pdf; Supplier: LCSC; ConvertToPcb: yes; FootprintName: LQFP-144_L20.0-W20.0-P0.50-LS22.0-BL; Core Processor: ARM® Cortex®-M4; Voltage - Supply (Vcc/Vdd): 1.8V ~ 3.6V; EEPROM Size: -; I2C（SMBUS/PMBUS）: 3; USB Host/OTG: 1; Features: I2S
USB3 = TYPE-C 16PIN 2MD(073): 连接器类型:Type-C;协议标准:-;公母:母;安装方式:卧贴;触点数量:16P;端口数量:1;额定电流 - 电源:3A;工作温度:-25℃~+85℃;; Manufacturer: SHOU HAN(首韩); AddInBom: yes; ModelId: 3a41b9ec9b654a0fad4d118405ec6290; ModelTransform: 351.9678,298.4246,0,0,0,0,0,-47.244,-35.433; Gender: 母; Number of Contacts: 16P; Number of Ports: 1; Current Rating-Power: 3A; Voltage Rating: 5V; Connect-Disconnect Life: 5千次; Detection color: 黑色; Symbol: TYPE-C 16PIN 2MD(073); Device: TYPE-C 16PIN 2MD(073); LCSC Part Name: Type-C 母 卧贴; SupplierPart: C2765186; ManufacturerPart: TYPE-C 16PIN 2MD(073); Supplier Footprint: SMD; JLCPCB Part Class: 扩展库; Datasheet: https://item.szlcsc.com/datasheet/TYPE-C%252016PIN%25202MD(073)/2901843.html; Supplier: LCSC; ConvertToPcb: yes; FootprintName: USB-C-SMD_TYPE-C-6PIN-2MD-073; ModelName: USB-C-SMD_TYPE-C-6PIN-2MD-073; Connector Type: Type-C; Protocol Standard: -; Mounting Type: 卧贴; Supplementary Features: -; Center Height: -; Length: -; Operating Temperature: -25℃~+85℃
X3 = X503225MSB2GI: 晶振类型:贴片晶振;频率:25MHz;常温频差:±10ppm;负载电容:20pF;频率稳定度:±20ppm;; Manufacturer: YXC(扬兴晶振); AddInBom: yes; ModelId: 36c8b961b9064b60a7c920ab5154e867; ModelName: OSC-SMD_L5.0-W3.2-H1.4; ModelTransform: 196.85,126.023,0,0,0,0,0,0,0; Normal temperature Frequency Tolerance: ±10ppm; Load Capacitance: 20pF; Frequency Stability: ±20ppm; Symbol: X503225MSB2GI; Device: X503225MSB2GI; LCSC Part Name: YSX530GA 25MHZ 2P 5032 20PF ±10PPM -40~85℃ (±20PPM); SupplierPart: C112569; ManufacturerPart: X503225MSB2GI; Supplier Footprint: SMD5032-2P; JLCPCB Part Class: 扩展库; Datasheet: https://item.szlcsc.com/datasheet/X503225MSB2GI/113802.html; Supplier: LCSC; ConvertToPcb: yes; FootprintName: OSC-SMD_L5.0-W3.2; Type: 贴片晶振; Value: 25MHz; Operating Temperature: -40℃~+85℃
X4 = FC31M2-32.768-NTLLLDT: 晶振类型:贴片无源晶振;频率:32.768kHz;频率公差:±20ppm;频率稳定度:±20ppm;负载电容:12.5pF;等效串联电阻(ESR):50kΩ;工作温度:-40~+85;; Manufacturer: HCI(杭晶); AddInBom: yes; ModelId: 762d7afc596f4558a373612390f4386d; ModelTransform: 126,59.1,0,0,0,0,0,0,0; Crystal Type: 贴片无源晶振; Load Capacitance: 12.5pF; Frequency Tolerance: ±20ppm; Equivalent Series Resistance (ESR): 50kΩ; Supplier Part: x; Operating Temperature: -40~+85; Device: FC31M2-32.768-NTLLLDT; Symbol: FC31M2-32.768-NTLLLDT; LCSC Part Name: 32.768kHz ±20ppm 12.5pF; ManufacturerPart: FC31M2-32.768-NTLLLDT; Supplier Footprint: SMD3215-2P; JLCPCB Part Class: Extended Part; Datasheet: https://atta.szlcsc.com/upload/public/pdf/source/20210629/C2842180_48F42A0423E39BF52E220D7A1E6B6693.pdf; Supplier: LCSC; ConvertToPcb: yes; FootprintName: crystal-smd_l3.2-w1.5-1; ModelName: CRYSTAL-SMD_L3.2-W1.5-1; Frequency Stability: ±20ppm